# Altium schematic sheet GPIOs_Expander_Relay_Sheet.SchDoc
size 420 x 297 mm; SheetNumber: 6; SheetTotal: 8
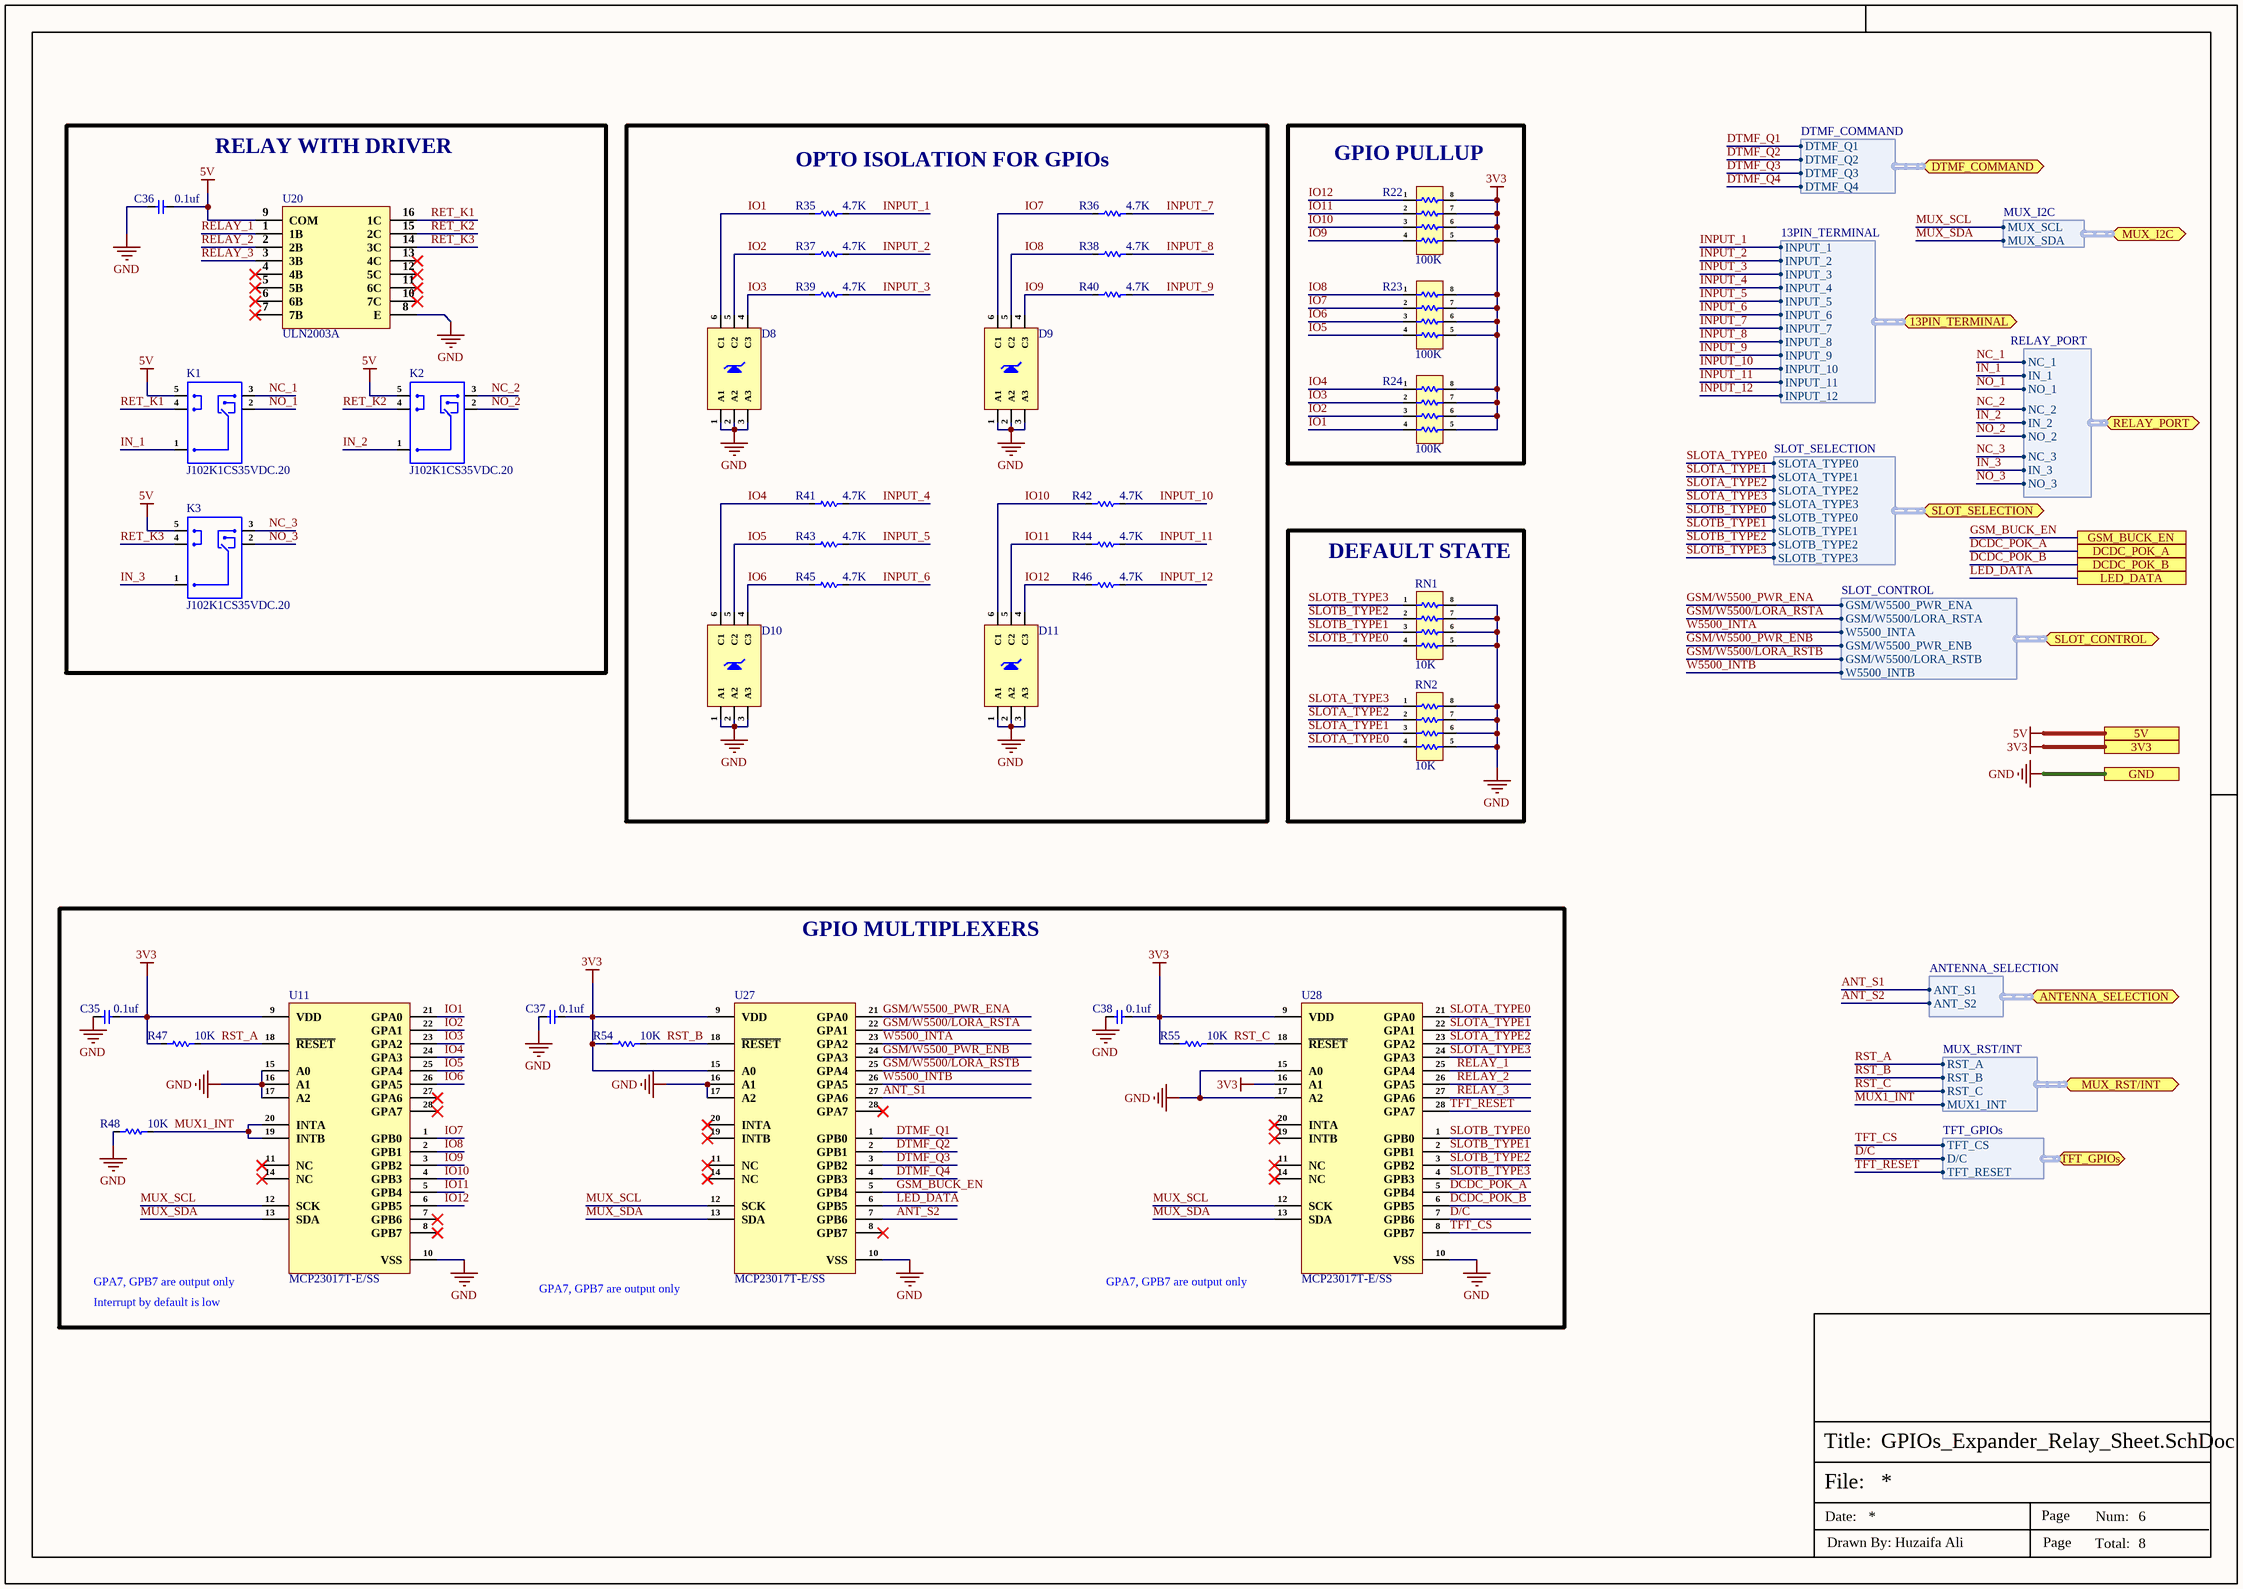
[diagram p0: GPIOs_Expander_Relay_Sheet.SchDoc]

## Parts
C35  0.1uf  [Cap-0402]
C36  0.1uf  [Cap-0402]
C37  0.1uf  [Cap-0402]
C38  0.1uf  [Cap-0402]
D8  BZX84C3V3TS-7-F  [SOT-363]  (value not drawn)
D9  BZX84C3V3TS-7-F  [SOT-363]  (value not drawn)
D10  BZX84C3V3TS-7-F  [SOT-363]  (value not drawn)
D11  BZX84C3V3TS-7-F  [SOT-363]  (value not drawn)
K1  J102K1CS35VDC.20  [J102K1CS35VDC.20]
K2  J102K1CS35VDC.20  [J102K1CS35VDC.20]
K3  J102K1CS35VDC.20  [J102K1CS35VDC.20]
R22  100K  [YC164-JR-070RL]
R23  100K  [YC164-JR-070RL]
R24  100K  [YC164-JR-070RL]
R35  4.7K  [Res-0402]
R36  4.7K  [Res-0402]
R37  4.7K  [Res-0402]
R38  4.7K  [Res-0402]
R39  4.7K  [Res-0402]
R40  4.7K  [Res-0402]
R41  4.7K  [Res-0402]
R42  4.7K  [Res-0402]
R43  4.7K  [Res-0402]
R44  4.7K  [Res-0402]
R45  4.7K  [Res-0402]
R46  4.7K  [Res-0402]
R47  10K  [Res-0201]
R48  10K  [Res-0201]
R54  10K  [Res-0201]
R55  10K  [Res-0201]
RN1  10K  [YC164-FR-0710KL]
RN2  10K  [YC164-FR-0710KL]
U11  MCP23017T-E/SS  [SSOP-28-208mil]
U20  ULN2003A  [SOP-16_150mil]
U27  MCP23017T-E/SS  [SSOP-28-208mil]
U28  MCP23017T-E/SS  [SSOP-28-208mil]

## Blocks framed on the sheet
RELAY WITH DRIVER: C36 K1-K3 U20
OPTO ISOLATION FOR GPIOs: D8-D11 R35-R46
GPIO PULLUP: R22-R24
DEFAULT STATE: RN1 RN2
GPIO MULTIPLEXERS: C35 C37 C38 R47 R48 R54 R55 U11 U27 U28

## Ports
3V3, 5V, 13PIN_TERMINAL (bidir, harness 13PIN_TERMINAL), ANTENNA_SELECTION (bidir, harness ANTENNA_SELECTION), DCDC_POK_A, DCDC_POK_B, DTMF_COMMAND (bidir, harness DTMF_COMMAND), GND, GSM_BUCK_EN, LED_DATA, MUX_I2C (bidir, harness MUX_I2C), MUX_RST/INT (bidir, harness MUX_RST/INT), RELAY_PORT (bidir, harness RELAY_PORT), SLOT_CONTROL (bidir, harness SLOT_CONTROL), SLOT_SELECTION (bidir, harness SLOT_SELECTION), TFT_GPIOs (bidir, harness TFT_GPIOs)

## Harnesses
DTMF_COMMAND: DTMF_Q1, DTMF_Q2, DTMF_Q3, DTMF_Q4
SLOT_SELECTION: SLOTA_TYPE0, SLOTA_TYPE1, SLOTA_TYPE2, SLOTA_TYPE3, SLOTB_TYPE0, SLOTB_TYPE1, SLOTB_TYPE2, SLOTB_TYPE3
MUX_I2C: MUX_SCL, MUX_SDA
SLOT_CONTROL: GSM/W5500_PWR_ENA, GSM/W5500/LORA_RSTA, W5500_INTA, GSM/W5500_PWR_ENB, GSM/W5500/LORA_RSTB, W5500_INTB
ANTENNA_SELECTION: ANT_S1, ANT_S2
RELAY_PORT: NC_1, NC_2, IN_1, IN_2, NO_1, NO_2, NC_3, IN_3, NO_3
13PIN_TERMINAL: INPUT_7, INPUT_1, INPUT_2, INPUT_8, INPUT_3, INPUT_9, INPUT_4, INPUT_10, INPUT_5, INPUT_11, INPUT_6, INPUT_12
MUX_RST/INT: RST_A, RST_B, RST_C, MUX1_INT
TFT_GPIOs: TFT_CS, D/C, TFT_RESET

## Nets
3V3: C35.1 C37.1 C38.1 R22.5 R22.6 R22.7 R22.8 R23.5 R23.6 R23.7 R23.8 R24.5 R24.6 R24.7 R24.8 R47.2 R54.2 R55.2 U11.9(VDD) U27.9(VDD) U27.15(A0) U28.9(VDD) U28.16(A1) ; port 3V3
5V: C36.1 K1.5 K2.5 K3.5 U20.9(COM) ; port 5V
GND: C35.2 C36.2 C37.2 C38.2 D8.1(A1) D8.2(A2) D8.3(A3) D9.1(A1) D9.2(A2) D9.3(A3) D10.1(A1) D10.2(A2) D10.3(A3) D11.1(A1) D11.2(A2) D11.3(A3) R48.2 RN1.5 RN1.6 RN1.7 RN1.8 RN2.5 RN2.6 RN2.7 RN2.8 U11.10(VSS) U11.15(A0) U11.16(A1) U11.17(A2) U20.8(E) U27.10(VSS) U27.16(A1) U27.17(A2) U28.10(VSS) U28.15(A0) U28.17(A2) ; port GND
ANT_S1: U27.27(GPA6) ; port ANTENNA_SELECTION.ANT_S1
ANT_S2: U27.7(GPB6) ; port ANTENNA_SELECTION.ANT_S2
D/C: U28.7(GPB6) ; port TFT_GPIOs.D/C
DCDC_POK_A: U28.5(GPB4) ; port DCDC_POK_A
DCDC_POK_B: U28.6(GPB5) ; port DCDC_POK_B
DTMF_Q1: U27.1(GPB0) ; port DTMF_COMMAND.DTMF_Q1
DTMF_Q2: U27.2(GPB1) ; port DTMF_COMMAND.DTMF_Q2
DTMF_Q3: U27.3(GPB2) ; port DTMF_COMMAND.DTMF_Q3
DTMF_Q4: U27.4(GPB3) ; port DTMF_COMMAND.DTMF_Q4
GSM/W5500/LORA_RSTA: U27.22(GPA1) ; port SLOT_CONTROL.GSM/W5500/LORA_RSTA
GSM/W5500/LORA_RSTB: U27.25(GPA4) ; port SLOT_CONTROL.GSM/W5500/LORA_RSTB
GSM/W5500_PWR_ENA: U27.21(GPA0) ; port SLOT_CONTROL.GSM/W5500_PWR_ENA
GSM/W5500_PWR_ENB: U27.24(GPA3) ; port SLOT_CONTROL.GSM/W5500_PWR_ENB
GSM_BUCK_EN: U27.5(GPB4) ; port GSM_BUCK_EN
IN_1: K1.1 ; port RELAY_PORT.IN_1
IN_2: K2.1 ; port RELAY_PORT.IN_2
IN_3: K3.1 ; port RELAY_PORT.IN_3
INPUT_1: R35.1 ; port 13PIN_TERMINAL.INPUT_1
INPUT_2: R37.1 ; port 13PIN_TERMINAL.INPUT_2
INPUT_3: R39.1 ; port 13PIN_TERMINAL.INPUT_3
INPUT_4: R41.1 ; port 13PIN_TERMINAL.INPUT_4
INPUT_5: R43.1 ; port 13PIN_TERMINAL.INPUT_5
INPUT_6: R45.1 ; port 13PIN_TERMINAL.INPUT_6
INPUT_7: R36.1 ; port 13PIN_TERMINAL.INPUT_7
INPUT_8: R38.1 ; port 13PIN_TERMINAL.INPUT_8
INPUT_9: R40.1 ; port 13PIN_TERMINAL.INPUT_9
INPUT_10: R42.1 ; port 13PIN_TERMINAL.INPUT_10
INPUT_11: R44.1 ; port 13PIN_TERMINAL.INPUT_11
INPUT_12: R46.1 ; port 13PIN_TERMINAL.INPUT_12
IO1: D8.6(C1) R24.4 R35.2 U11.21(GPA0)
IO2: D8.5(C2) R24.3 R37.2 U11.22(GPA1)
IO3: D8.4(C3) R24.2 R39.2 U11.23(GPA2)
IO4: D10.6(C1) R24.1 R41.2 U11.24(GPA3)
IO5: D10.5(C2) R23.4 R43.2 U11.25(GPA4)
IO6: D10.4(C3) R23.3 R45.2 U11.26(GPA5)
IO7: D9.6(C1) R23.2 R36.2 U11.1(GPB0)
IO8: D9.5(C2) R23.1 R38.2 U11.2(GPB1)
IO9: D9.4(C3) R22.4 R40.2 U11.3(GPB2)
IO10: D11.6(C1) R22.3 R42.2 U11.4(GPB3)
IO11: D11.5(C2) R22.2 R44.2 U11.5(GPB4)
IO12: D11.4(C3) R22.1 R46.2 U11.6(GPB5)
LED_DATA: U27.6(GPB5) ; port LED_DATA
MUX1_INT: R48.1 U11.19(INTB) U11.20(INTA) ; port MUX_RST/INT.MUX1_INT
MUX_SCL: U11.12(SCK) U27.12(SCK) U28.12(SCK) ; port MUX_I2C.MUX_SCL
MUX_SDA: U11.13(SDA) U27.13(SDA) U28.13(SDA) ; port MUX_I2C.MUX_SDA
NC_1: K1.3 ; port RELAY_PORT.NC_1
NC_2: K2.3 ; port RELAY_PORT.NC_2
NC_3: K3.3 ; port RELAY_PORT.NC_3
NO_1: K1.2 ; port RELAY_PORT.NO_1
NO_2: K2.2 ; port RELAY_PORT.NO_2
NO_3: K3.2 ; port RELAY_PORT.NO_3
RELAY_1: U20.1(1B) U28.25(GPA4)
RELAY_2: U20.2(2B) U28.26(GPA5)
RELAY_3: U20.3(3B) U28.27(GPA6)
RET_K1: K1.4 U20.16(1C)
RET_K2: K2.4 U20.15(2C)
RET_K3: K3.4 U20.14(3C)
RST_A: R47.1 U11.18(~{RESET}) ; port MUX_RST/INT.RST_A
RST_B: R54.1 U27.18(~{RESET}) ; port MUX_RST/INT.RST_B
RST_C: R55.1 U28.18(~{RESET}) ; port MUX_RST/INT.RST_C
SLOTA_TYPE0: RN2.4 U28.21(GPA0) ; port SLOT_SELECTION.SLOTA_TYPE0
SLOTA_TYPE1: RN2.3 U28.22(GPA1) ; port SLOT_SELECTION.SLOTA_TYPE1
SLOTA_TYPE2: RN2.2 U28.23(GPA2) ; port SLOT_SELECTION.SLOTA_TYPE2
SLOTA_TYPE3: RN2.1 U28.24(GPA3) ; port SLOT_SELECTION.SLOTA_TYPE3
SLOTB_TYPE0: RN1.4 U28.1(GPB0) ; port SLOT_SELECTION.SLOTB_TYPE0
SLOTB_TYPE1: RN1.3 U28.2(GPB1) ; port SLOT_SELECTION.SLOTB_TYPE1
SLOTB_TYPE2: RN1.2 U28.3(GPB2) ; port SLOT_SELECTION.SLOTB_TYPE2
SLOTB_TYPE3: RN1.1 U28.4(GPB3) ; port SLOT_SELECTION.SLOTB_TYPE3
TFT_CS: U28.8(GPB7) ; port TFT_GPIOs.TFT_CS
TFT_RESET: U28.28(GPA7) ; port TFT_GPIOs.TFT_RESET
W5500_INTA: U27.23(GPA2) ; port SLOT_CONTROL.W5500_INTA
W5500_INTB: U27.26(GPA5) ; port SLOT_CONTROL.W5500_INTB

Not connected (* = marked no-connect by the designer): U11 7(GPB6)* 8(GPB7)* 11(NC)* 14(NC)* 27(GPA6)* 28(GPA7)*; U20 4(4B)* 5(5B)* 6(6B)* 7(7B)* 10(7C)* 11(6C)* 12(5C)* 13(4C)*; U27 8(GPB7)* 11(NC)* 14(NC)* 19(INTB)* 20(INTA)* 28(GPA7)*; U28 11(NC)* 14(NC)* 19(INTB)* 20(INTA)*

## Notes on the sheet
- (near U11) GPA7, GPB7 are output only
- Interrupt by default is low
- (near U27) GPA7, GPB7 are output only
- (near U28) GPA7, GPB7 are output only
- File:
- Title:
- Date:
- Page
- Num:
- Total:
- Drawn By: Huzaifa Ali

## Library data of the parts
C35-C38 = GRM155R62A104KE14D: CAP CER 0.1UF 100V X5R 0402; Manufacturer: Murata; Capacitance: 100nF; Tolerance: 10%; Item Type: Capacitor; Supplier 1: Arrow Electronics; Manufacturer Part Number: GRM155R62A104KE14D; RoHS: Yes; Category: Ceramic Capacitors; Stock 1: 870000; Pricing 1: 10000=0.00500, 20000=0.00410, 30000=0.00390, 50000=0.00370, 100000=0.00300 (USD); Mount: Surface Mount; Case/Package: 0402; Case Code (Metric): 1005; Case Code (Imperial): 0402; Weight: 0.000212oz; Min Operating Temperature: -55°C; Max Operating Temperature: 85°C; Packaging: Tape and Reel; Voltage Rating: 100V; Dielectric: X5R; Termination: SMD/SMT; Voltage Rating (DC): 100V; Package Quantity: 10000; Series: GRM; Length: 0.039inch; Width: 0.02inch; Height: 0.5mm; Thickness: 0.022inch; Reach SVHC Compliant: Yes; Lead Free: Lead Free; RoHS Compliant: Yes; ComponentLink1URL: http://www.farnell.com/datasheets/2079151.pdf?src-supplier=Farnell; ComponentLink1Description: http://www.farnell.com/datasheets/2079151.pdf?src-supplier=Farnell; ComponentLink2URL: http://www.mouser.com/ds/2/281/c02e-2905.pdf?src-supplier=Mouser; ComponentLink2Description: http://www.mouser.com/ds/2/281/c02e-2905.pdf?src-supplier=Mouser; ComponentLink3URL: http://www.farnell.com/datasheets/2079151.pdf?src-supplier=Element14; ComponentLink3Description: http://www.farnell.com/datasheets/2079151.pdf?src-supplier=Element14; ComponentLink4URL: http://search.murata.co.jp/Ceramy/image/img/A01X/G101/ENG/GRM155R62A104KE14-01.pdf?src-supplier=Digi-Key; ComponentLink4Description: http://search.murata.co.jp/Ceramy/image/img/A01X/G101/ENG/GRM155R62A104KE14-01.pdf?src-supplier=Digi-Key; ComponentLink5URL: http://www.farnell.com/datasheets/2079151.pdf?src-supplier=Newark; ComponentLink5Description: http://www.farnell.com/datasheets/2079151.pdf?src-supplier=Newark; Supplier Part Number 1: GRM155R62A104KE14D; LCSC Part Number: C162178
D8-D11 = BZX84C3V3TS-7-F: DIODE ZENER ARRAY 3.3V SOT363; Manufacturer: Diodes Incorporated; Manufacturer Part Number: BZX84C3V3TS-7-F; Package: SOT-363-6; LCSC Part Number: C5124989; Item Type: Diode; ComponentLink1Description: LCSC; ComponentLink1URL: https://www.lcsc.com/product-detail/Zener-Diodes_Diodes-Incorporated-BZX84C3V3TS-7-F_C5124989.html
K1-K3 = J102K1CS35VDC.20: RELAY GEN PURPOSE SPDT 3A 5V; Manufacturer: CIT Relay & Switch; Supplier: Digi-Key; Supplier Part Number: 2449-J102K1CS35VDC.20-ND; Manufacturer Part Number: J102K1CS35VDC.20; RoHS: No; Category: Power Relays; Stock: 15659; Pricing: 1=0.97, 10=0.909, 25=0.808, 50=0.7676, 100=0.7272, 250=0.6464, 500=0.606, 1000=0.5656, 5000=0.5454 (USD)
R22-R24 = YC164-JR-07100KL: RES ARRAY 4 RES 100K OHM 1206; Manufacturer: Yageo; Item Type: Resistor; Supplier: Future Electronics; Supplier Part Number: 4734737; Manufacturer Part Number: YC164-JR-07100KL; RoHS: Yes; Category: Resistor Arrays; Stock: 10000; Pricing: 5000=0.0086, 20000=0.0082, 50000=0.0078, 100000=0.0078, 125000=0.0075, 200000=0.0076, 625000=0.0071 (USD); ComponentLink1URL: https://datasheet.ciiva.com/11807/0900766b80c69e1d-11807026.pdf?src-supplier=Rs; ComponentLink1Description: https://datasheet.ciiva.com/11807/0900766b80c69e1d-11807026.pdf?src-supplier=Rs; ComponentLink2URL: https://datasheet.ciiva.com/8017/443424-8017993.pdf?src-supplier=Element14; ComponentLink2Description: https://datasheet.ciiva.com/8017/443424-8017993.pdf?src-supplier=Element14; ComponentLink3URL: https://datasheet.ciiva.com/8017/443424-8017994.pdf?src-supplier=Element14; ComponentLink3Description: https://datasheet.ciiva.com/8017/443424-8017994.pdf?src-supplier=Element14; ComponentLink4URL: https://datasheet.ciiva.com/17478/pyu-yc-tc164-51-rohs-l-3-17478885.pdf?src-supplier=Future+Electronics; ComponentLink4Description: https://datasheet.ciiva.com/17478/pyu-yc-tc164-51-rohs-l-3-17478885.pdf?src-supplier=Future+Electronics; ComponentLink5URL: https://datasheet.ciiva.com/2693/pyu-yc-tc164-51-rohs-l-3-2693249.pdf?src-supplier=Digi-Key; ComponentLink5Description: https://datasheet.ciiva.com/2693/pyu-yc-tc164-51-rohs-l-3-2693249.pdf?src-supplier=Digi-Key; ComponentLink6URL: https://datasheet.ciiva.com/2693/pyu-yc-tc164-51-rohs-l-3-2693250.pdf?src-supplier=Digi-Key; ComponentLink6Description: https://datasheet.ciiva.com/2693/pyu-yc-tc164-51-rohs-l-3-2693250.pdf?src-supplier=Digi-Key; ComponentLink7URL: https://datasheet.ciiva.com/2693/pyu-yc-tc164-51-rohs-l-3-2693251.pdf?src-supplier=Digi-Key; ComponentLink7Description: https://datasheet.ciiva.com/2693/pyu-yc-tc164-51-rohs-l-3-2693251.pdf?src-supplier=Digi-Key; LCSC Part Number: C192933
R35-R46 = RC0402FR-074K7L: RES 4.7K OHM 1% 1/16W 0402; Manufacturer: Yageo; Voltage Rating (DC): 50V; Power Rating: 62.5mW; Resistance: 4.7kR; Temperature Coefficient: 100ppm/°C; Max Power Dissipation: 63mW; Item Type: Resistor; Supplier 1: Avnet; Manufacturer Part Number: RC0402FR-074K7L; RoHS: Yes; Category: Chip SMD Resistors; Stock 1: 2420000; Pricing 1: 10000=0.00085 (USD); Case/Package: 0402; Number of Pins: 2; Case Code (Imperial): 0402; Case Code (Metric): 1005; Size Code: 0402; Min Operating Temperature: -55°C; Max Operating Temperature: 155°C; Tolerance: 1%; Voltage Rating: 50V; Packaging: Tape and Reel; Resistor Type: Thick Film; Termination: SMD/SMT; Features: Moisture Resistant; Series: RC; Number of Terminations: 2; Resistance Tolerance: 1%; Construction: Rectangular; Length: 1mm; Width: 0.5mm; Height: 0.32mm; Depth: 0.5mm; Height - Seated (Max): 0.016inch; RoHS Compliant: Yes; Reach SVHC Compliant: Yes; Military Standard: Not; Lead Free: Lead Free; ComponentLink1URL: https://datasheet.ciiva.com/22661/1686128-22661342.pdf?src-supplier=Element14; ComponentLink1Description: https://datasheet.ciiva.com/22661/1686128-22661342.pdf?src-supplier=Element14; ComponentLink2URL: https://datasheet.ciiva.com/7850/1018594-7850022.pdf?src-supplier=Element14; ComponentLink2Description: https://datasheet.ciiva.com/7850/1018594-7850022.pdf?src-supplier=Element14; ComponentLink3URL: https://datasheet.ciiva.com/7850/1018594-7850023.pdf?src-supplier=Element14; ComponentLink3Description: https://datasheet.ciiva.com/7850/1018594-7850023.pdf?src-supplier=Element14; ComponentLink4URL: https://datasheet.ciiva.com/15215/getdatasheetpartid-328119-15215035.pdf?src-supplier=Verical; ComponentLink4Description: https://datasheet.ciiva.com/15215/getdatasheetpartid-328119-15215035.pdf?src-supplier=Verical; Supplier Part Number 1: RC0402FR-074K7L; LCSC Part Number: C105871
R47 R48 R54 R55 = RC0201FR-0710KL: RES SMD 10K OHM 1% 1/20W 0201; Manufacturer: Yageo; Item Type: Resistor; Manufacturer Part Number: RC0201FR-0710KL; Package: 0201; ComponentLink7Description: LCSC; ComponentLink7URL: https://www.lcsc.com/product-detail/Chip-Resistor-Surface-Mount_YAGEO-RC0201FR-0710KL_C106225.html; LCSC Part Number: C106225
RN1 RN2 = YC164-FR-0710KL: RES ARRAY 4 RES 10K OHM 1206; Manufacturer: Yageo; Tolerance: 1%; Voltage Rating: 50V; Number of Elements: 4; Value: 10kR; Circuit Type: Isolated; Power Per Element: 62.5mW; Temperature Coefficient: 200ppm/°C; Item Type: Resistor Array; Supplier 1: Future Electronics; Manufacturer Part Number: YC164-FR-0710KL; RoHS: Yes; Category: Resistor Arrays; Stock 1: 25000; Pricing 1: 5000=0.0101, 20000=0.0095, 50000=0.0092, 125000=0.0089, 200000=0.0085 (USD); Mounting Technology: Surface Mount; Pins: 8; Case Code (Metric): 3216; Case Code (Imperial): 1206; Min Operating Temperature: -55°C; Max Operating Temperature: 155°C; Packaging: Tape and Reel; Number of Resistors: 4; Number of Circuits: 4; Series: YC164; Resistance Tolerance: 1%; Length: 0.126inch; Width: 0.063inch; Height: 0.028inch; Lead Free: Lead Free; RoHS Compliant: Yes; Reach SVHC Compliant: Unknown; ComponentLink1URL: http://www.farnell.com/datasheets/2167431.pdf?src-supplier=Farnell; ComponentLink1Description: http://www.farnell.com/datasheets/2167431.pdf?src-supplier=Farnell; ComponentLink2URL: https://media.digikey.com/pdf/Data%20Sheets/Yageo%20PDFs/YC102-358,TC122-164_Series_DS.pdf?src-supplier=Digi-Key; ComponentLink2Description: https://media.digikey.com/pdf/Data%20Sheets/Yageo%20PDFs/YC102-358,TC122-164_Series_DS.pdf?src-supplier=Digi-Key; ComponentLink3URL: http://www.farnell.com/datasheets/2167431.pdf?src-supplier=Element14; ComponentLink3Description: http://www.farnell.com/datasheets/2167431.pdf?src-supplier=Element14; ComponentLink4URL: http://www.farnell.com/datasheets/443424.pdf?src-supplier=Element14; ComponentLink4Description: http://www.farnell.com/datasheets/443424.pdf?src-supplier=Element14; ComponentLink5URL: http://www.farnell.com/datasheets/2167431.pdf?src-supplier=Newark; ComponentLink5Description: http://www.farnell.com/datasheets/2167431.pdf?src-supplier=Newark; Supplier Part Number 1: 5054288; LCSC Part Number: C110924
U11 U27 U28 = MCP23017T-E/SS: IC XPNDR 1.7MHZ I2C 28SSOP; Manufacturer: Microchip; Operating Supply Voltage: 5.5V; Interface: I2C,Serial; Number of Channels: 1; Output Current: 25mA; Number of I/Os: 16; Power Dissipation: 700mW; Clock Frequency: 10MHz; Output Type: PUSH-PULL; Supply Current: 1mA; Supplier 1: Digi-Key; Manufacturer Part Number: MCP23017T-E/SS; RoHS: Yes; Category: Interface ICs; Stock 1: 26314; Pricing 1: 1=1.69, 25=1.4, 100=1.28 (USD); Mounting Technology: Surface Mount; Case/Package: SSOP; Pins: 28; Min Operating Temperature: -40°C; Max Operating Temperature: 125°C; Package Quantity: 2100; Series: -; Packaging: Tape and Reel; Frequency: 1.7MHz; Number of Bits: 16; Nominal Supply Voltage: 5.5V; Lead Free: Lead Free; RoHS Compliant: Yes; ComponentLink1URL: https://datasheet.ciiva.com/12267/21952b-12267583.pdf?src-supplier=Mouser; ComponentLink1Description: https://datasheet.ciiva.com/12267/21952b-12267583.pdf?src-supplier=Mouser; ComponentLink2URL: https://datasheet.ciiva.com/8128/21952b-8128586.pdf?src-supplier=Avnet; ComponentLink2Description: https://datasheet.ciiva.com/8128/21952b-8128586.pdf?src-supplier=Avnet; ComponentLink3URL: https://datasheet.ciiva.com/16454/filehandler-aspxddocname-en023709-16454267.pdf?src-supplier=Future+Electronics; ComponentLink3Description: https://datasheet.ciiva.com/16454/filehandler-aspxddocname-en023709-16454267.pdf?src-supplier=Future+Electronics; ComponentLink4URL: https://datasheet.ciiva.com/1780/21952b-1780738.pdf?src-supplier=Digi-Key; ComponentLink4Description: https://datasheet.ciiva.com/1780/21952b-1780738.pdf?src-supplier=Digi-Key; Supplier Part Number 1: MCP23017T-E/SSCT-ND; LCSC Part Number: C558584; Item Type: IC
U20 = ULN2003A: 100uA@50V 3V@2V,300mA 1.6V@350mA 4mA@12V 100uA@50V 1.25V@350mA 500mA 25pF SOP-16_150mil Darlington Transistor Arrays ROHS; Manufacturer: Mixic; Item Type: IC; Manufacturer Part Number: ULN2003A; Package: SOP-16_150mil; LCSC Part Number: C181730; ComponentLink1Description: LCSC; ComponentLink1URL: https://www.lcsc.com/product-detail/Darlington-Transistor-Arrays_Mixic-ULN2003A_C181730.html